# EAGLE design TLC (EAGLE 9.6.2)
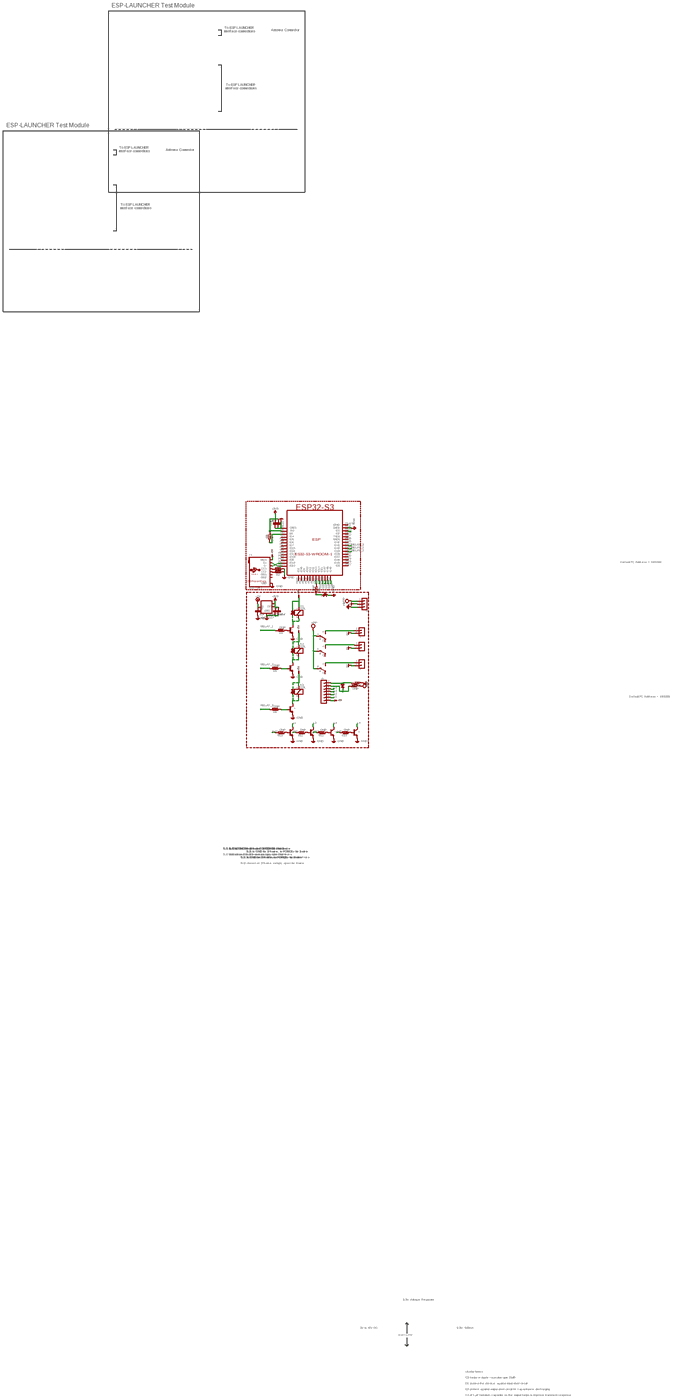
[diagram p0: schematic, sheet 1, overview]
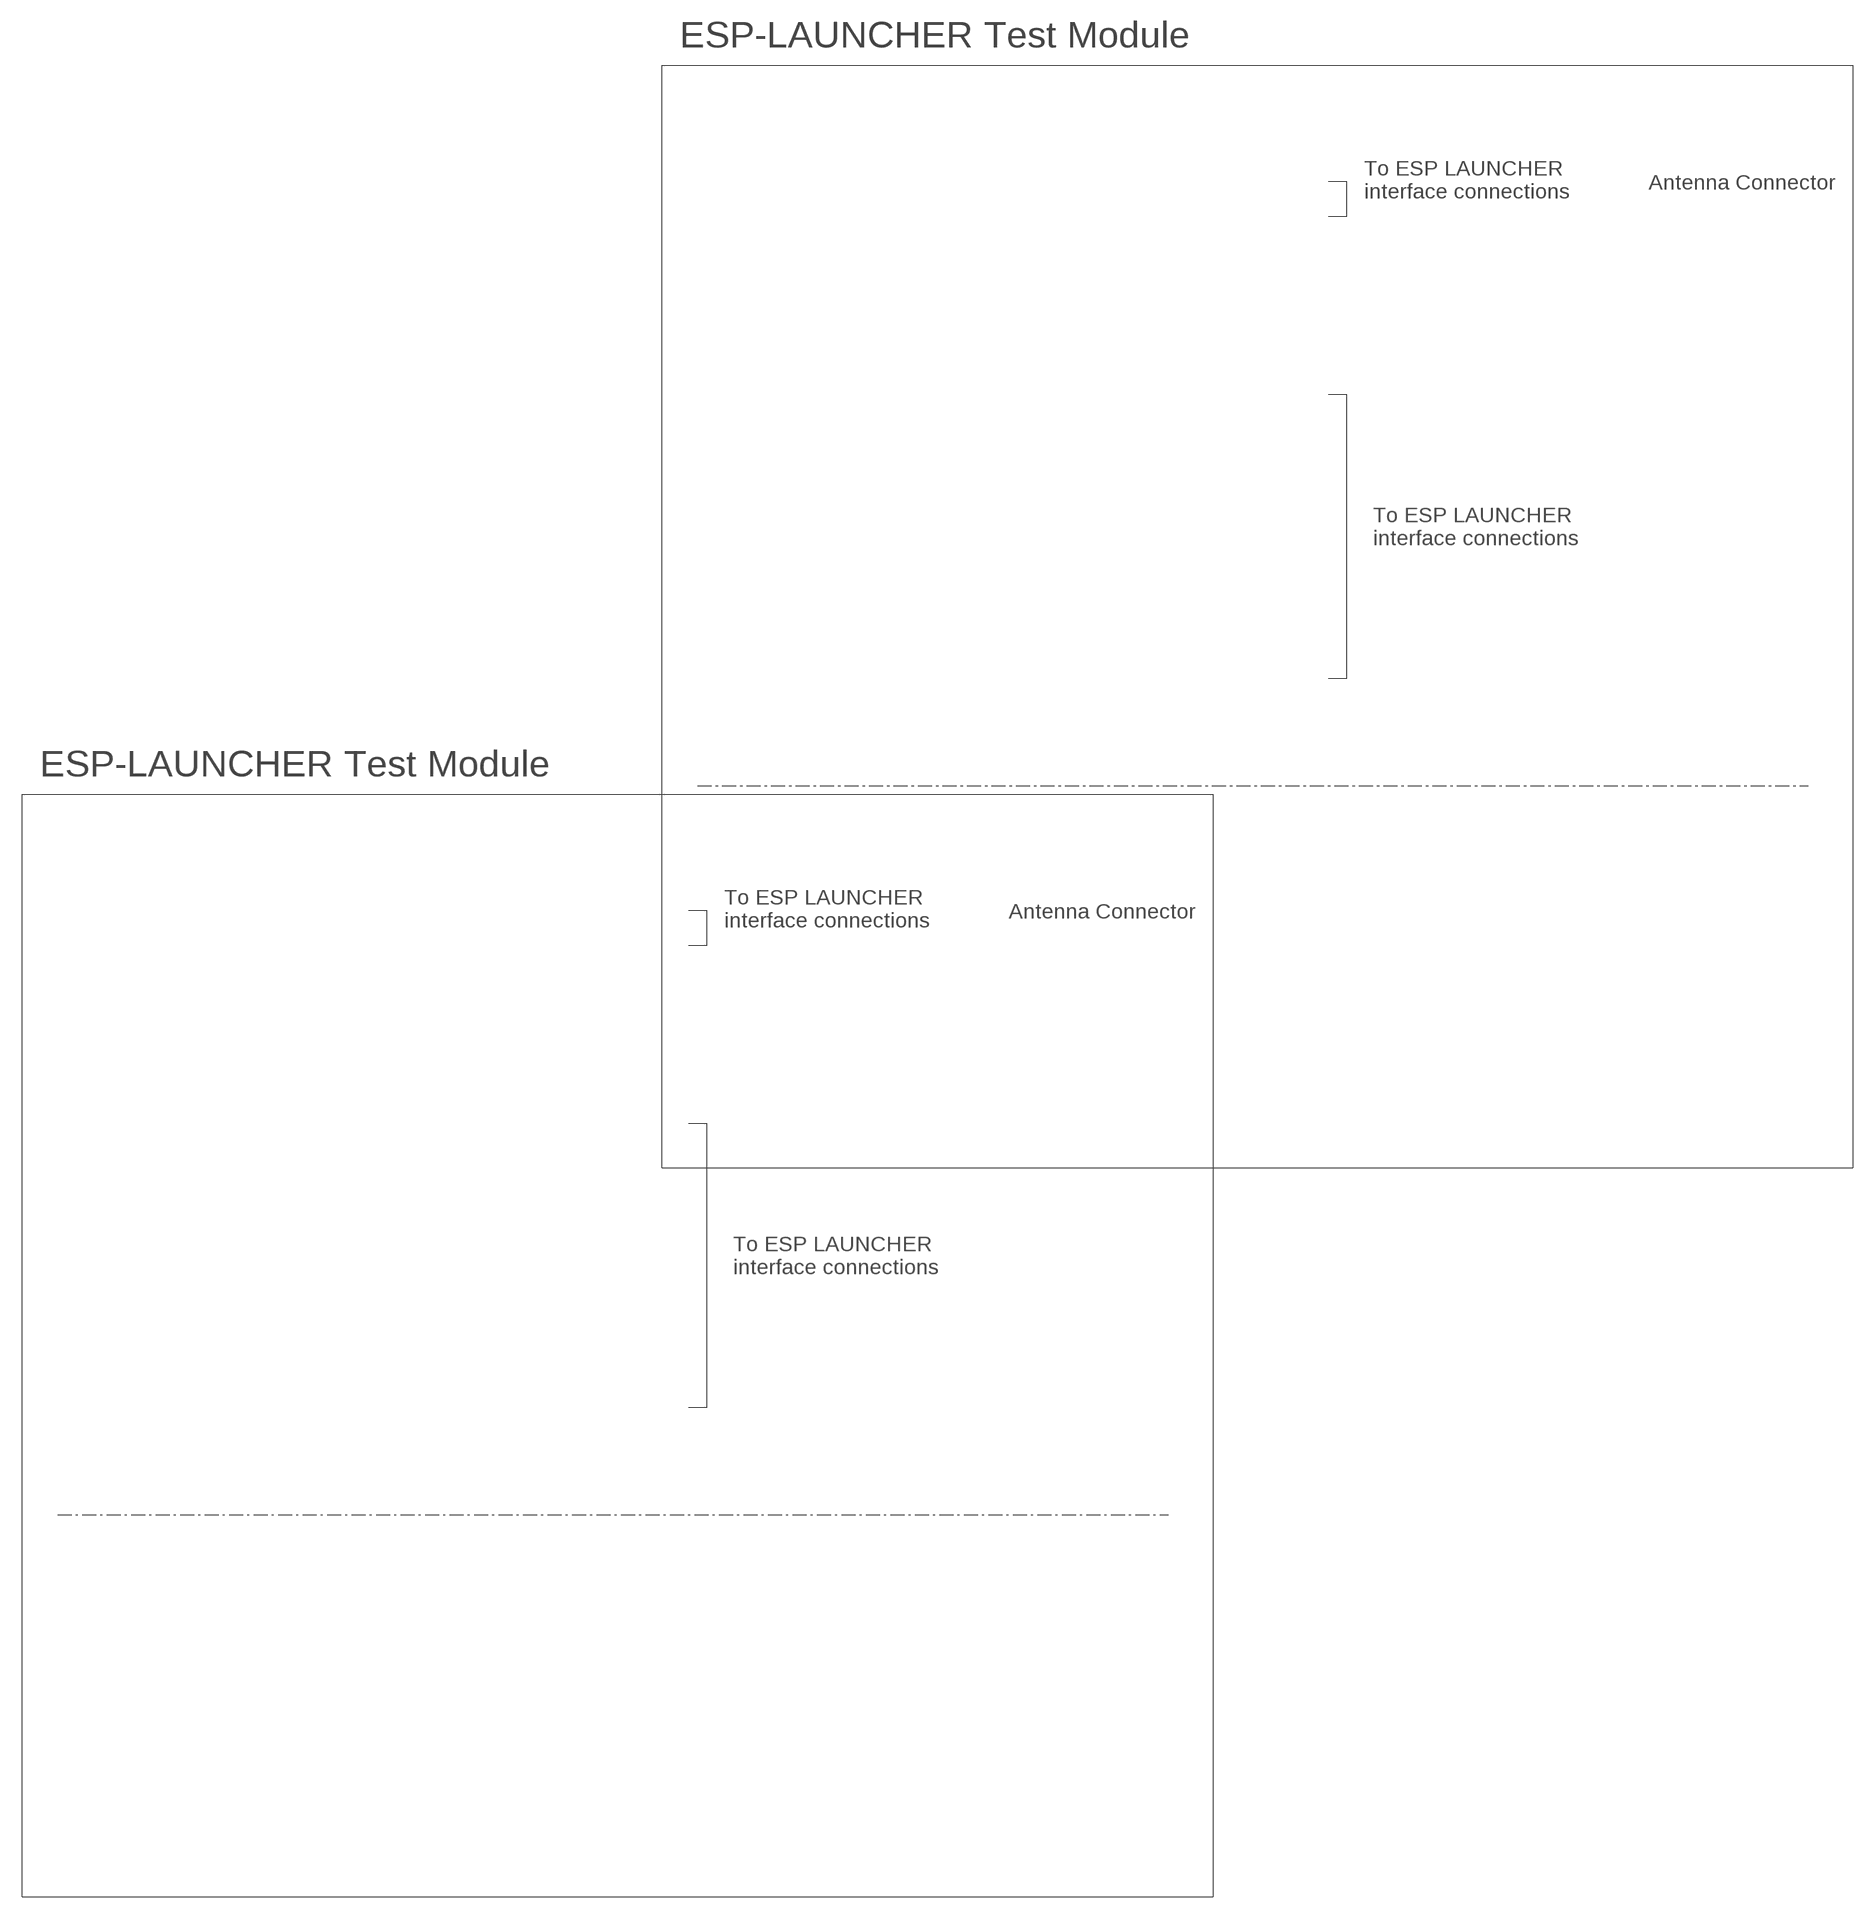
[diagram p1: schematic, sheet 1, part 1 of 4]
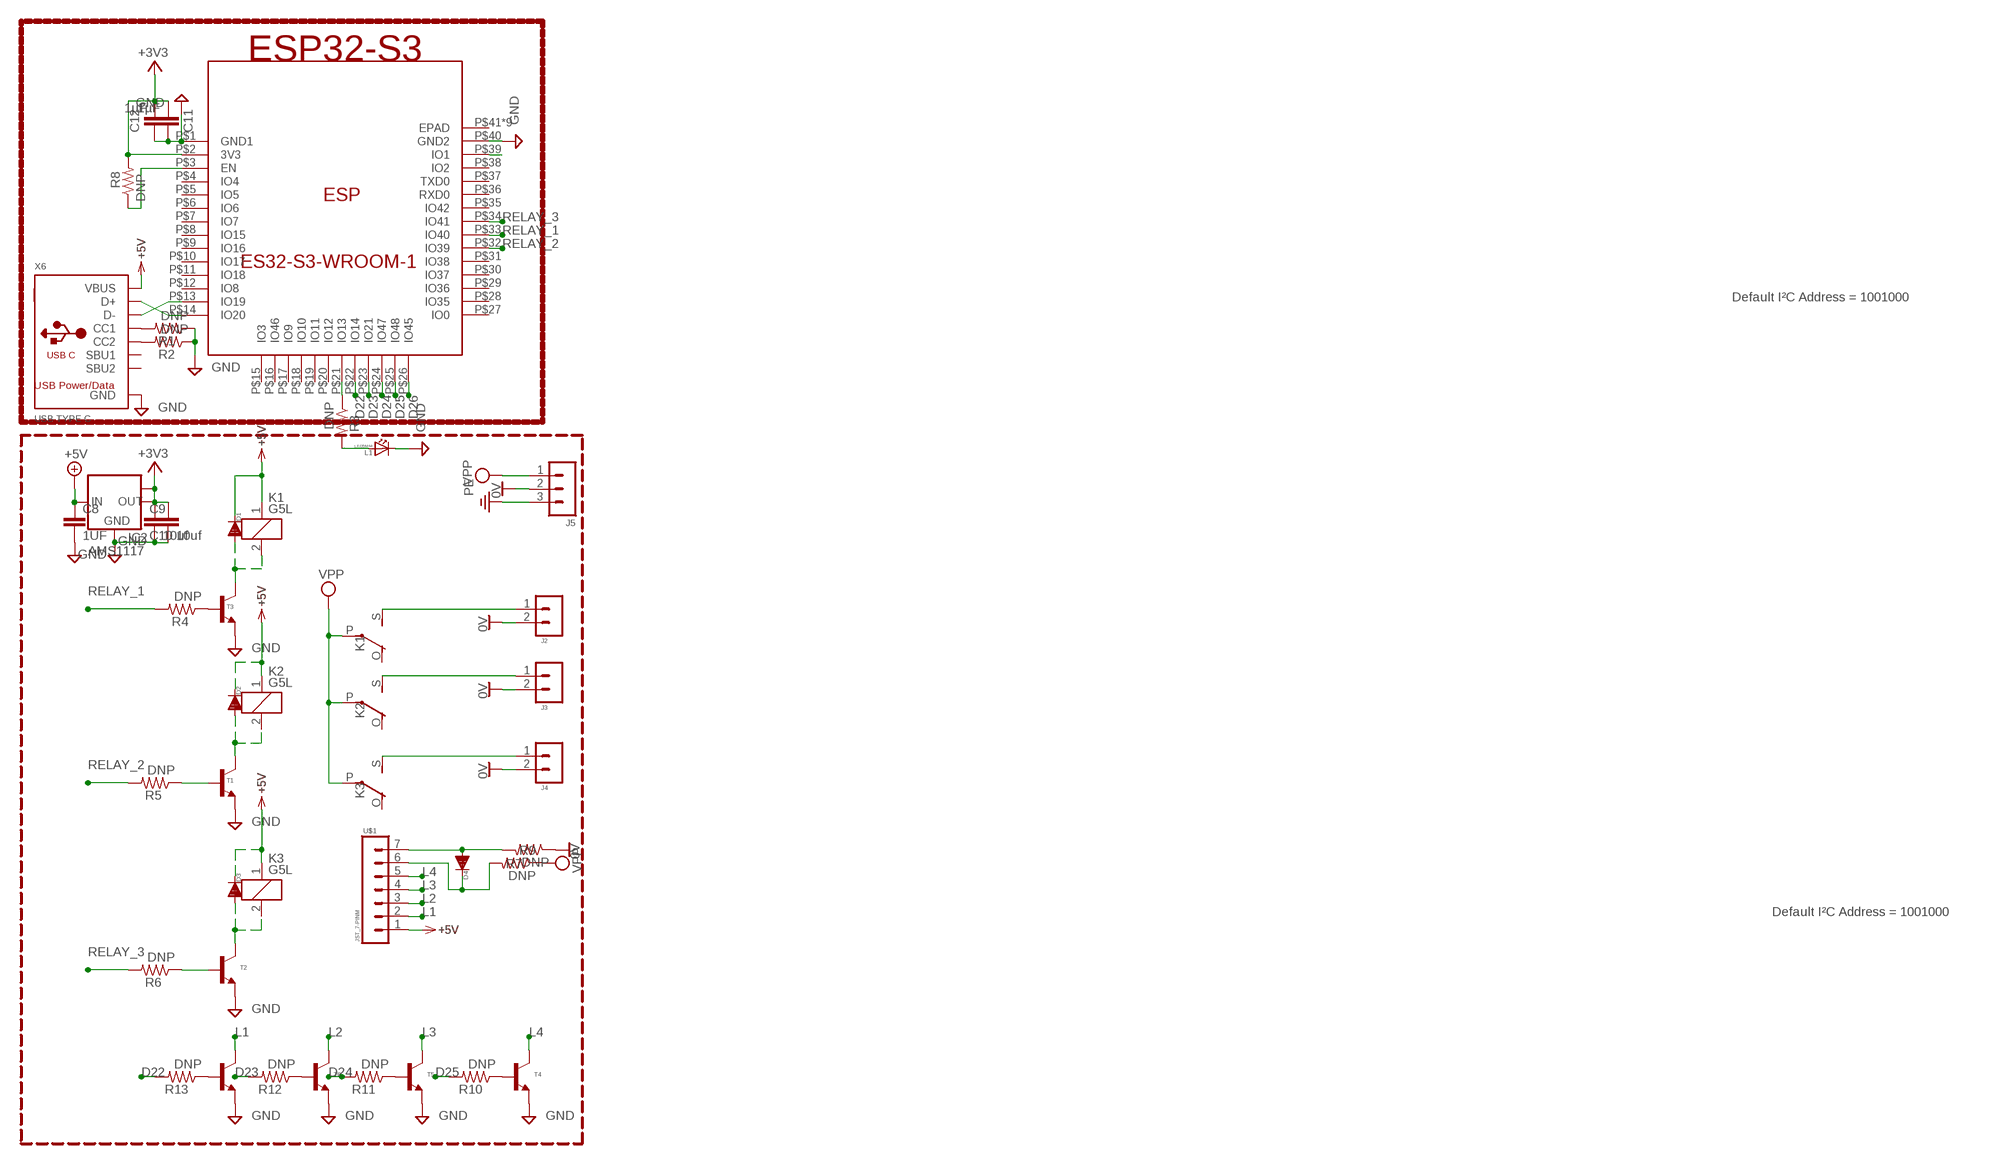
[diagram p2: schematic, sheet 1, part 2 of 4]
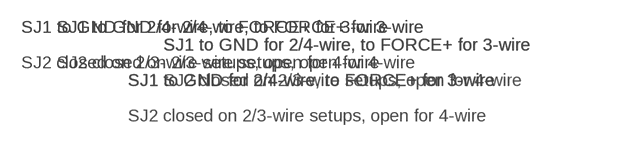
[diagram p3: schematic, sheet 1, part 3 of 4]
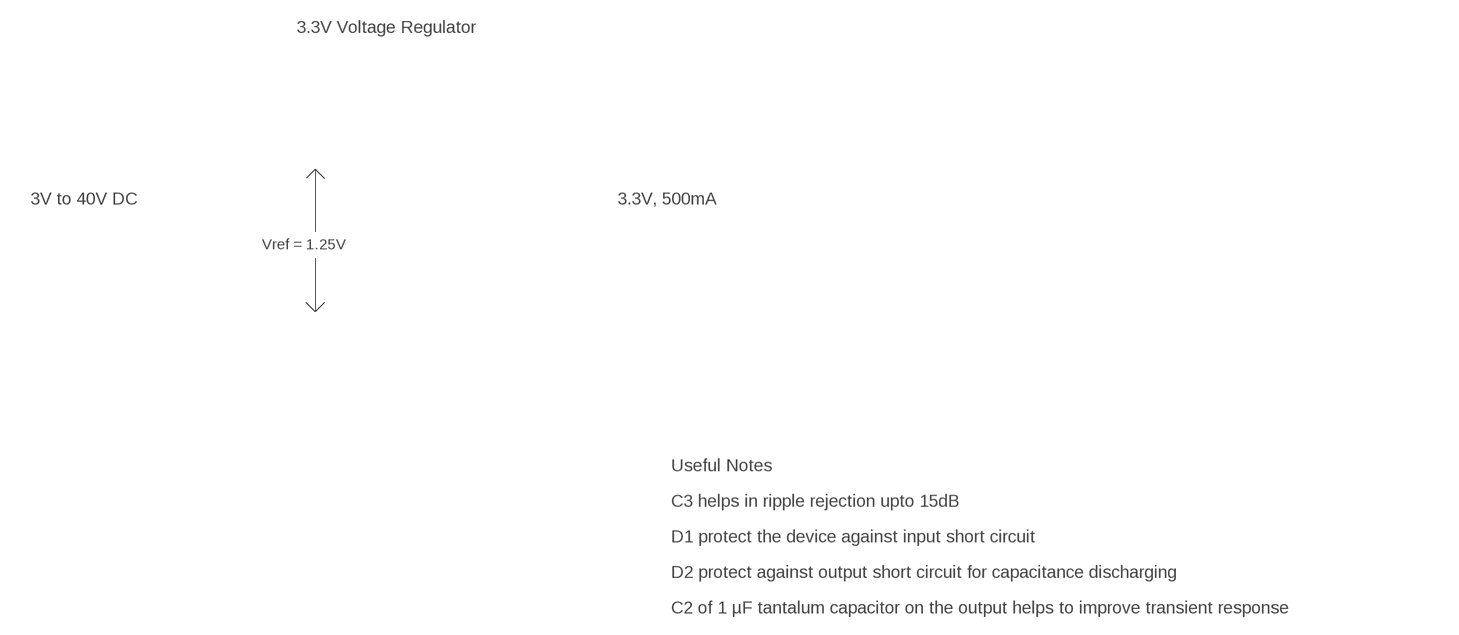
[diagram p4: schematic, sheet 1, part 4 of 4]

## Parts
C8  1UF  C-EUC1206K  [C1206K]
C9  10uf  C-EUC1206K  [C1206K]
C10  10uf  C-EUC1206K  [C1206K]
C11  1µF  C-EUC0805K  [C0805K]
C12  1µF  C-EUC0805K  [C0805K]
D1  DIODE80  [SOD-80]
D2  DIODE80  [SOD-80]
D3  DIODE80  [SOD-80]
D4  DIODE80  [SOD-80]
ESP  ES32-S3-WROOM-1  [ESP32-S3-WROOM-1]
IC2  AMS1117  LM1117MPX-5.0  [SOT223]
J2  JST_2-PIN_1.27MMBPT_3.5MM  [BPT-2_PIN_3.5MM]
J3  JST_2-PIN_1.27MMBPT_3.5MM  [BPT-2_PIN_3.5MM]
J4  JST_2-PIN_1.27MMBPT_3.5MM  [BPT-2_PIN_3.5MM]
J5  JST_3-PINPWR_3  [3-PIN_3.96_PWR]
K1  G5L  [G5LE]
K2  G5L  [G5LE]
K3  G5L  [G5LE]
L1  LED5MM  [LED_5MM]
R1  DNP  R-US_R0603  [R0603]
R2  DNP  R-US_R0603  [R0603]
R3  DNP  R-US_R0603  [R0603]
R4  DNP  R-US_R0603  [R0603]
R5  DNP  R-US_R0603  [R0603]
R6  DNP  R-US_R1206  [R1206]
R7  DNP  R-US_R0603  [R0603]
R8  DNP  R-US_R0603  [R0603]
R9  DNP  R-US_R0603  [R0603]
R10  DNP  R-US_R0603  [R0603]
R11  DNP  R-US_R0603  [R0603]
R12  DNP  R-US_R0603  [R0603]
R13  DNP  R-US_R0603  [R0603]
T1  TRANSISTOR_NPNSOT-23  [SOT-23]
T2  TRANSISTOR_NPNSOT-23  [SOT-23]
T3  TRANSISTOR_NPNSOT-23  [SOT-23]
T4  TRANSISTOR_NPNSOT-23  [SOT-23]
T5  TRANSISTOR_NPNSOT-23  [SOT-23]
T6  TRANSISTOR_NPNSOT-23  [SOT-23]
T7  TRANSISTOR_NPNSOT-23  [SOT-23]
U$1  JST_7-PINM  [MOLEX_7-PIN]
X6  USB TYPE C  USB_C  [USB_C_CUSB31-CFM2AX-01-X]

## Nets
0V: J2.2 J3.2 J4.2 J5.2 R9.1
+3V3: C9.1 C10.1 C11.2 C12.2 ESP.P$2(3V3) IC2.2(OUT) IC2.TAB(OUT1) R8.2
+5V: C8.1 D1.K D2.K D3.K IC2.3(IN) K1.1 K2.1 K3.1 U$1.1 X6.A4B9(VBUS) X6.B4A9(VBUS)
D22: ESP.P$22(IO14) R13.2
D23: ESP.P$23(IO21) R12.2
D24: ESP.P$24(IO47) R11.2
D25: ESP.P$25(IO48) R10.2
D26: ESP.P$26(IO45)
GND: C8.2 C9.2 C10.2 C11.1 C12.1 ESP.P$1(GND1) ESP.P$40(GND2) IC2.1(GND) L1.K R1.1 R2.1 T1.2(E) T2.2(E) T3.2(E) T4.2(E) T5.2(E) T6.2(E) T7.2(E) X6.A1B12(GND) X6.B1A12(GND)
L1: T7.3(C) U$1.2
L2: T6.3(C) U$1.3
L3: T5.3(C) U$1.4
L4: T4.3(C) U$1.5
N$1: R1.2 X6.A5(CC1)
N$2: R2.2 X6.B5(CC2)
N$3: ESP.P$39(IO1)
N$4: ESP.P$21(IO13) R3.1
N$5: L1.A R3.2
N$6: R5.1 T1.1(B)
N$7: D4.K R7.2 U$1.6
N$8: R4.1 T3.1(B)
N$9: J4.1 K3.S(2:S)
N$10: D1.A K1.2 T3.3(C)
N$11: D4.A R9.2 U$1.7
N$12: D2.A K2.2 T1.3(C)
N$13: R10.1 T4.1(B)
N$14: R6.1 T2.1(B)
N$15: ESP.P$3(EN) R8.1
N$16: ESP.P$13(IO19) X6.A7(D-) X6.B7(D-)
N$17: ESP.P$14(IO20) X6.A6(D+) X6.B6(D+)
N$18: D3.A K3.2 T2.3(C)
N$19: J3.1 K2.S(2:S)
N$20: J2.1 K1.S(2:S)
N$22: R11.1 T5.1(B)
N$24: R12.1 T6.1(B)
N$26: R13.1 T7.1(B)
PE: J5.3
RELAY_1: ESP.P$33(IO40) R4.2
RELAY_2: ESP.P$32(IO39) R5.2
RELAY_3: ESP.P$34(IO41) R6.2
VPP: J5.1 K1.P(2:P) K2.P(2:P) K3.P(2:P) R7.1
Unconnected: ESP.P$4(IO4) ESP.P$5(IO5) ESP.P$6(IO6) ESP.P$7(IO7) ESP.P$8(IO15) ESP.P$9(IO16) ESP.P$10(IO17) ESP.P$11(IO18) ESP.P$12(IO8) ESP.P$15(IO3) ESP.P$16(IO46) ESP.P$17(IO9) ESP.P$18(IO10) ESP.P$19(IO11) ESP.P$20(IO12) ESP.P$27(IO0) ESP.P$28(IO35) ESP.P$29(IO36) ESP.P$30(IO37) ESP.P$31(IO38) ESP.P$35(IO42) ESP.P$36(RXD0) ESP.P$37(TXD0) ESP.P$38(IO2) ESP.P$41(EPAD) ESP.P$42(EPAD) ESP.P$43(EPAD) ESP.P$44(EPAD) ESP.P$45(EPAD) ESP.P$46(EPAD) ESP.P$47(EPAD) ESP.P$48(EPAD) ESP.P$49(EPAD) K1.O(2:O) K2.O(2:O) K3.O(2:O) X6.A8(SBU1) X6.B8(SBU2)

## Notes on the sheet
- ESP-LAUNCHER Test Module
- Antenna Connector
- To ESP LAUNCHER
  interface connections
- To ESP LAUNCHER
  interface connections
- ESP-LAUNCHER Test Module
- Antenna Connector
- To ESP LAUNCHER
  interface connections
- To ESP LAUNCHER
  interface connections
- Default I²C Address = 1001000
- USB Power/Data
- Default I²C Address = 1001000
- SJ1 to GND for 2/4-wire, to FORCE+ for 3-wire | SJ1 to GND for 2/4-wire, to FORCE+ for 3-wire | SJ1 to GND for 2/4-wire, to FORCE+ for 3-wire | SJ1 to GND for 2/4-wire, to FORCE+ for 3-wire
- SJ1 to GND for 2/4-wire, to FORCE+ for 3-wire | SJ1 to GND for 2/4-wire, to FORCE+ for 3-wire
- SJ2 closed on 2/3-wire setups, open for 4-wire | SJ2 closed on 2/3-wire setups, open for 4-wire
- SJ1 to GND for 2/4-wire, to FORCE+ for 3-wire | SJ1 to GND for 2/4-wire, to FORCE+ for 3-wire | SJ2 closed on 2/3-wire setups, open for 4-wire
- SJ2 closed on 2/3-wire setups, open for 4-wire
- 3.3V Voltage Regulator
- 3V to 40V DC | 3.3V, 500mA
- Vref = 1.25V
- Useful Notes
- C3 helps in ripple rejection upto 15dB
- D1 protect the device against input short circuit
- D2 protect against output short circuit for capacitance discharging
- C2 of 1 µF tantalum capacitor on the output helps to improve transient response

## Library data of the parts
C8-C12 = rcl:C-EU: CAPACITOR, European symbol; SPICEPREFIX: C
D1-D4 = Squadron:DIODE
ESP = ESP32 Module:ES32-S3-WROOM-1
IC2 = lm1117:LM1117MPX-*
J2-J4 = Squadron:JST_2-PIN_1.27MM
J5 = Squadron:JST_3-PIN
K1-K3 = relay:G5L: RELAY 1 x switch, 10 A/120 V AC, 8 A/30 V ADC, Omron
L1 = Squadron:LED
R1-R13 = rcl:R-US_: RESISTOR, American symbol; SPICEPREFIX: R
T1-T7 = Squadron:TRANSISTOR_NPN
U$1 = Squadron:JST_7-PIN
X6 = adafruit_electromech:USB_C: USB Type-C USB 2.0 Connector

## Module WAVESHAREDISPLAY
Ports: 

### Library data of the parts

## Board
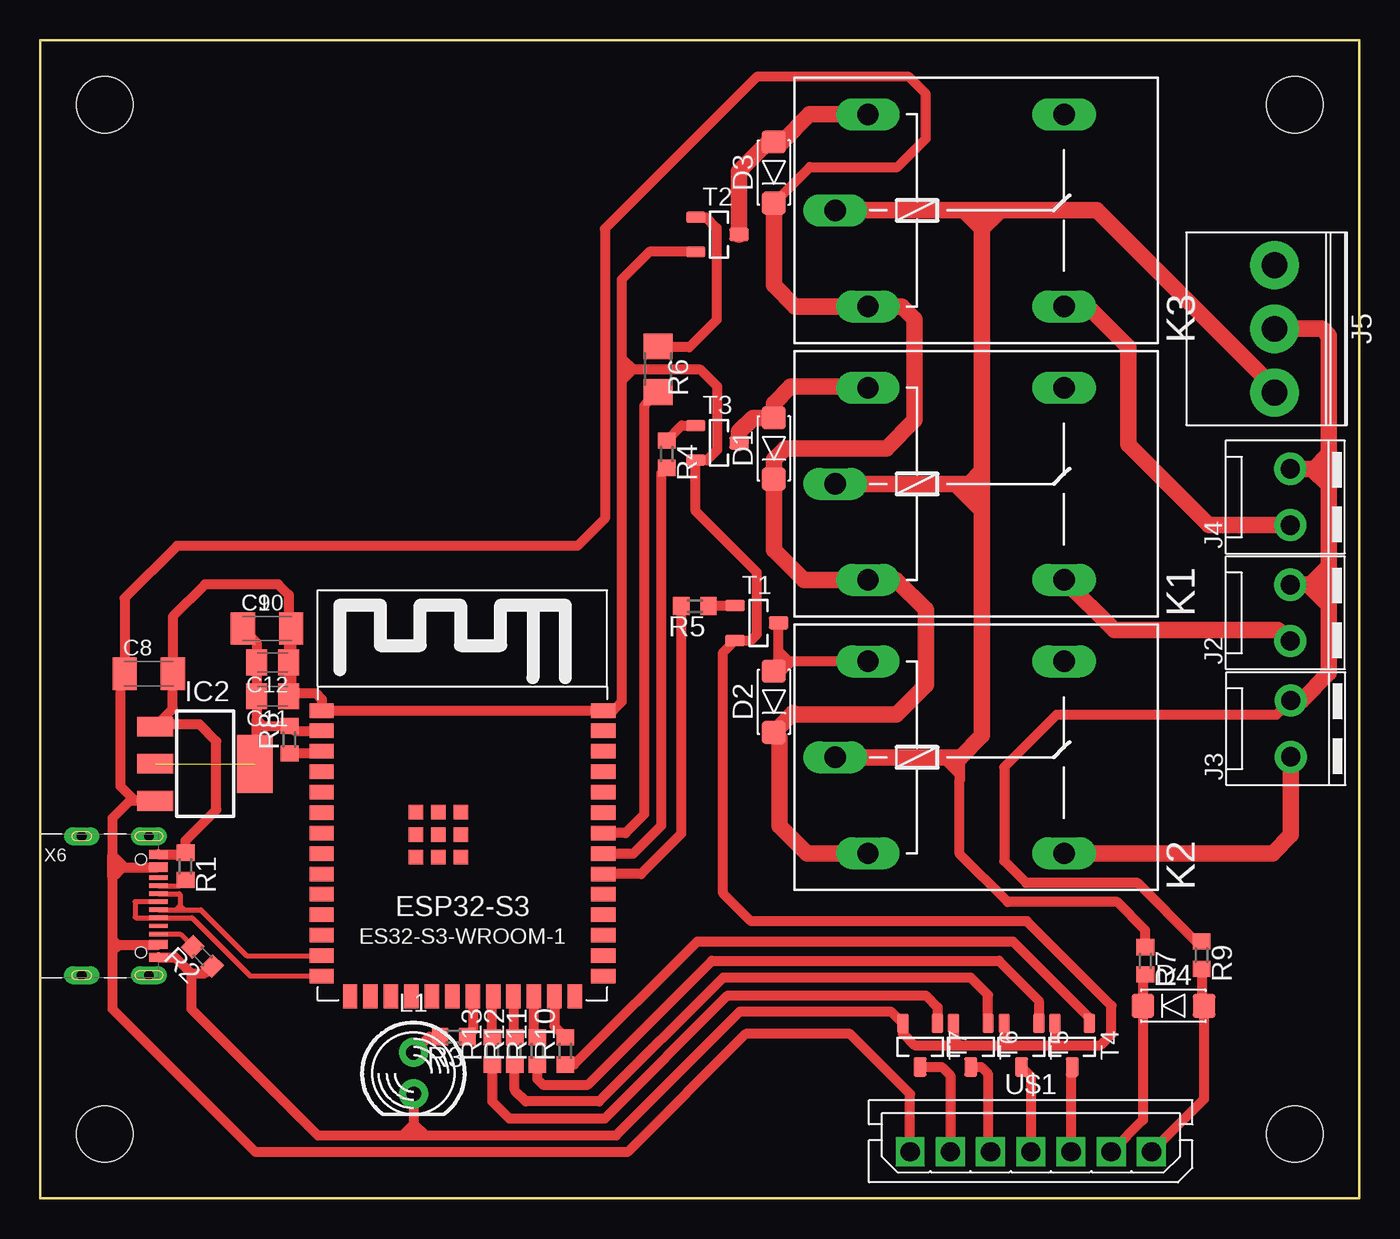
[diagram p5: board, top side]

Size 82 x 72 mm. Coordinates in mm from the lower left corner, seen from the top.
Outline: 0,0 82,0 82,72 0,72 0,0
Copper layers (1*16): Top 0.035mm / dielectric 1.5mm / Bottom 0.035mm
Design rules "default": minimum track width 6mil, minimum drill 0.35mm, track to track 6mil, track to pad 6mil, pad to pad 6mil, via to via 6mil, smd to smd 6mil, copper to edge 40mil, drill to drill 6mil, minimum pad ring 10mil, minimum via ring 8mil, stop-mask expansion 4mil, vias tented up to drill 0mil, thermal gap 10mil
Holes 3.5 mm at 4,68 4,4 78,4 78,68

### Footprints (pad centres in the part's own frame; a part is rotated, then mirrored left to right if it is on the bottom)
C1206K = smd 1.5 x 2: 1 -1.5,0; 2 1.5,0
C0805K = smd 1.3 x 1.6: 1 -1,0; 2 1,0
SOD-80 = smd 1.4 x 1.5: A -1.9,0; K 1.9,0
ESP32-S3-WROOM-1 = smd 1.5 x 0.9: P$1 0.25,18.01; P$2 0.25,16.74; P$3 0.25,15.47; P$4 0.25,14.2; P$5 0.25,12.93; P$6 0.25,11.66; P$7 0.25,10.39; P$8 0.25,9.12; P$9 0.25,7.85; P$10 0.25,6.58; P$11 0.25,5.31; P$12 0.25,4.04; P$13 0.25,2.77; P$14 0.25,1.5; P$27 17.75,1.5; P$28 17.75,2.77; P$29 17.75,4.04; P$30 17.75,5.31; P$31 17.75,6.58; P$32 17.75,7.85; P$33 17.75,9.12; P$34 17.75,10.39; P$35 17.75,11.66; P$36 17.75,12.93; P$37 17.75,14.2; P$38 17.75,15.47; P$39 17.75,16.74; P$40 17.75,18.01 | smd 0.9 x 1.5: P$15 2.015,0.25; P$16 3.285,0.25; P$17 4.555,0.25; P$18 5.825,0.25; P$19 7.095,0.25; P$20 8.365,0.25; P$21 9.635,0.25; P$22 10.905,0.25; P$23 12.175,0.25; P$24 13.445,0.25; P$25 14.715,0.25; P$26 15.985,0.25 | smd 0.9 x 0.9: P$41 6.1,11.69; P$42 7.5,11.69; P$43 8.9,11.69; P$44 6.1,10.29; P$45 7.5,10.29; P$46 8.9,10.29; P$47 6.1,8.89; P$48 7.5,8.89; P$49 8.9,8.89
SOT223 = smd 1.219 x 2.235: 1 -2.311,-3.099; 2 0,-3.099; 3 2.311,-3.099 | smd 3.6 x 2.2: TAB 0,3.099
BPT-2_PIN_3.5MM = drill 1.2 pad 2: 1 -1.75,0; 2 1.75,0
3-PIN_3.96_PWR = drill 1.6 pad 3: 1 3.96,5.5; 2 0,5.5; 3 -3.96,5.5
G5LE = drill 1.321 long: 1 -7.493,-5.969; 2 -7.493,5.969; O 4.699,5.969; P -9.525,0; S 4.699,-5.969
LED_5MM = drill 0.9 pad 1.8: A 0,-1.295; K -0.025,1.27
R0603 = smd 1 x 1.1: 1 -0.85,0; 2 0.85,0
R1206 = smd 1.6 x 1.803: 1 -1.422,0; 2 1.422,0
SOT-23 = smd 0.7 x 1.2: 1 -1.077,-1.35; 2 1.077,-1.35 | smd 0.8 x 1.2: 3 0,1.35
MOLEX_7-PIN = drill 1.2 pad 1.75 square: 1 7.5,0; 2 5,0; 3 2.5,0; 4 0,0; 5 -2.5,0; 6 -5,0; 7 -7.5,0
USB_C_CUSB31-CFM2AX-01-X = smd 0.575 x 1.15: A1B12 -3.2,3.545; A4B9 -2.4,3.545; B1A12 3.2,3.545; B4A9 2.4,3.545 | smd 0.275 x 1.15: A5 -1.25,3.545; A6 -0.25,3.545; A7 0.25,3.545; A8 1.25,3.545; B5 1.75,3.545; B6 0.75,3.545; B7 -0.75,3.545; B8 -1.75,3.545 | drill 0.6 pad 1 long: M1 -4.32,2.97; M2 4.32,2.97; M3 -4.32,-1.21; M4 4.32,-1.21 | hole 0.65: 2.89,2.47; -2.89,2.47

### Placement (x,y rotation side)
C8  6.75,32.62 0 top
C9  14.1,35.42 0 top
C10  14.1,35.42 0 top
C11  14.45,31.22 180 top
C12  14.45,33.32 180 top
D1  45.6,46.62 270 top
D2  45.6,30.87 270 top
D3  45.6,63.77 270 top
D4  70.45,11.97 180 top
ESP  17.25,12.32 0 top
IC2  10.25,27.02 270 top
J2  77.71,36.4 90 top
J3  77.74,29.2 90 top
J4  77.71,43.6 90 top
J5  71.24,54.06 270 top
K1  58.95,44.42 0 top
K2  58.95,27.42 0 top
K3  58.95,61.42 0 top
L1  23.2,7.77 180 top
R1  9.04,20.64 270 top
R2  10.09,15.04 135 top
R3  25.7,10.05 180 top
R4  38.95,46.27 270 top
R5  40.7,36.82 180 top
R6  38.4,51.54 270 top
R7  68.7,14.77 270 top
R8  15.5,28.52 90 top
R9  72.2,15.12 270 top
R10  32.65,9.17 90 top
R11  30.9,9.17 90 top
R12  29.5,9.17 90 top
R13  28.1,9.17 90 top
T1  44.55,35.77 270 top
T2  42.1,59.92 270 top
T3  42.1,46.97 270 top
T4  64.15,9.52 180 top
T5  61,9.52 180 top
T6  57.85,9.52 180 top
T7  54.7,9.52 180 top
U$1  61.58,2.9 180 top
X6  3.79,18.19 270 top

### Tracks (layer width: path | path; a pad name or v marks a point on that pad's centre or on a via)
0V
  Top 0.61: R9.1 71.85,15.97 68.22,19.6 61.3,19.6 59.93,20.97 59.93,26.82 63.17,30.06 76.85,30.06 J3.2
  Top 1.016: J3.2 78.41,30.95 80.11,32.65 80.11,36.85 | 78.81,38.15 80.11,36.85 | 78.81,38.15 J2.2 79.66,38.15 80.11,38.6 | 80.11,36.85 80.11,38.6 | 80.11,38.6 80.11,39.3 | 80.11,39.3 80.11,44.3 | 80.11,44.3 80.11,44.9 | 79.16,45.35 79.66,45.35 80.11,44.9 | J4.2 79.06,45.35 | J5.2 79.7,54.06 80.11,53.65 80.11,46.3 | 80.11,46.3 80.11,44.9 | 79.06,45.35 79.16,45.35 | 79.16,45.35 80.11,46.3 | 79.06,45.35 80.11,44.3 | 78.81,38.15 78.96,38.15 80.11,39.3
+3V3  (1 unrouted)
  Top 0.61: IC2.TAB 13.4,27.02 13.75,26.67 13.7,26.67 IC2.TAB | IC2.TAB 13.45,27.12 13.45,29.77 | 13.45,29.77 C11.2 C12.2 13.45,34.57 C10.1 | 13.45,29.77 13.85,29.37 R8.2 15.81,29.06 ESP.P$2
+5V
  Top 0.61: 46.8,30.17 46.73,30.09 45.85,29.22 D2.K | 4.78,20.23 4.49,19.94 | 4.67,20.11 5.14,20.59 | 5.14,20.59 X6.A4B9 | D3.K 47.85,64.12 53.3,64.12 55.05,65.87 55.05,68.67 54,69.72 44.55,69.72 35.1,60.27 35.1,42.27 33.4,40.57 8.5,40.57 5.25,37.32 C8.1 5,32.37 5,25.62 5.91,24.71 IC2.3 | U$1.1 54.08,6.49 50.35,10.22 43.85,10.22 36.5,2.87 13.4,2.87 4.49,11.78 4.49,15.39 | 4.49,19.94 4.49,16.09 | 4.49,16.09 4.49,15.74 | 4.49,15.74 4.49,15.39 | X6.B4A9 7.29,15.74 4.84,15.74 | 4.49,15.74 4.84,15.74 | 4.84,15.74 4.49,16.09 | 4.84,15.74 4.49,15.39 | 4.49,19.94 4.49,21.34 | 5.14,20.59 5.14,20.69 4.49,21.34 | IC2.3 7.01,24.57 | IC2.3 5.57,24.71 4.49,23.63 4.49,21.34
  Top 1.016: K2.1 47.67,21.45 45.95,23.17 45.95,28.62 D2.K | D3.K 45.6,56.77 46.92,55.45 K3.1 53.57,55.45 54.35,54.67 54.35,48.37 52.6,46.62 46.3,46.62 45.6,45.92 D1.K 45.6,40.32 47.47,38.45 K1.1 53.21,38.45 55.05,36.61 55.05,31.92 53.23,30.09 46.73,30.09 | 46.8,30.17 45.85,29.22
D22
  Top 0.61: R13.2 28.1,12.52 ESP.P$22
D23
  Top 0.61: ESP.P$23 29.43,10.1 R12.2
D24
  Top 0.61: R11.2 30.7,10.22 ESP.P$24
D25
  Top 0.61: ESP.P$25 31.96,10.71 R10.2
GND
  Top 0.305: R1.1 7.85,21.49 7.75,21.39
  Top 0.61: T2.2 37.87,58.84 36.15,57.12 36.15,52.22 | 36.15,52.22 36.15,51.52 | 36.15,51.52 36.15,50.82 | 36.15,50.82 36.15,30.87 35.61,30.33 ESP.P$40 ESP.P$1 17.5,31.03 17.15,31.38 15.61,31.38 C11.1 15.45,31.57 | 62.75,9.52 63.1,9.87 63.1,10.84 T4.2 | 56.45,9.52 54.35,9.52 53.62,10.25 T7.2 52.87,11.62 43.5,11.62 35.8,3.92 23.9,3.92 | 56.45,9.52 56.8,9.52 | 56.8,9.52 57.15,9.52 | 57.15,9.52 59.6,9.52 | 59.6,9.52 59.95,9.52 | 59.95,9.52 60.3,9.52 | 60.3,9.52 62.75,9.52 | 59.92,9.84 59.92,9.55 59.95,9.52 | T5.2 59.92,9.87 | 59.92,9.87 59.92,9.84 | 59.92,9.84 59.6,9.52 | 59.92,9.87 59.95,9.87 60.3,9.52 | T6.2 56.8,10.84 56.8,9.87 | 56.8,9.87 56.8,9.52 | 56.8,9.87 56.45,9.52 | 56.8,9.87 57.15,9.52 | X6.B1A12 8.39,14.99 9.39,13.99 | 23.2,3.92 23.9,3.92 | X6.A1B12 8.94,21.39 R1.1 9.04,22.24 10.95,24.15 10.95,28.42 9.9,29.47 7.15,29.47 IC2.1 8.25,30.43 C8.2 8.25,36.17 10.25,38.17 14.8,38.17 15.45,37.52 C12.1 15.45,31.92 | 36.85,51.52 41.05,51.52 42.1,50.47 42.1,46.54 41.45,45.89 T3.2 40.75,42.72 44.55,38.92 44.55,35.07 44.17,34.69 T1.2 42.45,33.94 42.45,18.97 44.2,17.22 61.35,17.22 66.6,11.97 66.6,10.22 65.9,9.52 62.75,9.52 | 36.15,51.52 36.85,51.52 | 36.15,52.22 36.85,51.52 | 36.85,51.52 36.15,50.82 | 15.45,31.92 15.45,31.57 | 15.45,31.57 15.6,31.72 C10.2 15.6,32.07 15.45,31.92 | 9.39,13.99 10.24,13.99 R2.1 | 9.39,13.99 9.39,11.78 17.25,3.92 22.52,3.92 | 22.52,3.92 23.2,3.92 | L1.K 23.23,4.62 | 23.23,4.62 23.23,3.94 23.2,3.92 | 23.23,4.62 22.52,3.92 | 23.23,4.62 23.9,3.94 23.9,3.92
L1
  Top 0.61: T7.3 56.05,8.17 56.58,7.64 U$1.2
L2
  Top 0.61: T6.3 58.5,8.17 58.9,7.77 58.9,3.08 U$1.3
L3
  Top 0.61: T5.3 61.58,7.59 U$1.4
L4
  Top 0.61: T4.3 64.08,8.1 U$1.5
N$1
  Top 0.305: X6.A5 8.69,19.44 R1.2
N$2
  Top 0.305: X6.B5 8.69,16.44 R2.2
N$4
  Top 0.61: R3.1 26.9,10.4 26.9,12.55 ESP.P$21
N$5
  Top 0.61: L1.A 24.18,10.05 R3.2
N$6
  Top 0.61: T1.1 43.17,36.82 R5.1
N$7
  Top 0.61: R7.2 68.55,13.77 D4.K 68.55,4.87 U$1.6
N$8
  Top 0.61: R4.1 39.88,48.05 T3.1
N$9
  Top 1.016: K3.S 65.12,55.45 67.65,52.92 67.65,46.86 72.66,41.85 J4.1
N$10
  Top 1.016: K1.2 51.38,50.47 46.65,50.47 45.6,49.42 D1.A 44.3,48.52 43.45,47.67 T3.3
N$11
  Top 0.61: R9.2 72.2,12.12 D4.A 72.35,6.17 U$1.7
N$12
  Top 0.61: 45.9,33.07 45.9,34.02 | 45.9,34.02 T1.3 | 45.9,33.07 46.22,33.39 46.53,33.39 | K2.2 46.65,33.39 | 46.65,33.39 46.53,33.39 | 46.53,33.39 45.9,34.02 | 46.65,33.39 46.65,33.32 45.95,32.62 45.75,32.62 D2.A 45.9,33.07
N$13
  Top 0.61: T4.1 65.23,11.22 60.5,15.95 40.83,15.95 33.2,8.32 R10.1
N$14
  Top 0.61: T2.1 41.37,61 42.04,60.33 42.04,54.61 40.35,52.92 38.44,52.92 R6.1
N$15
  Top 0.61: ESP.P$3 17.38,27.67 R8.1
N$16
  Top 0.305: X6.A7 8.44,17.94 | 8.44,17.94 8.69,17.94 | 8.69,17.94 8.94,17.94 | 8.94,17.94 9.99,17.94 12.84,15.09 ESP.P$13 | X6.B7 8.64,18.94 8.69,18.89 8.69,18.19 | 8.69,17.94 8.69,18.19 | 8.69,18.19 8.44,17.94 | 8.69,18.19 8.94,17.94
N$17
  Top 0.305: ESP.P$14 13.06,13.82 9.44,17.44 X6.B6 5.94,17.44 5.89,17.49 5.89,18.44 X6.A6
N$18
  Top 1.016: T2.3 43.45,63.87 45.25,65.67 D3.A 46.1,65.67 47.82,67.39 K3.2
N$19
  Top 1.016: K2.S 76.61,21.45 77.74,22.58 J3.1
N$20
  Top 1.016: J2.1 76.93,35.33 66.77,35.33 K1.S
N$22
  Top 0.61: R11.1 30.9,7.42 31.25,7.07 34.05,7.07 41.75,14.77 59.6,14.77 62.08,12.29 T5.1
N$24
  Top 0.61: 29.64,8.18 R12.1 29.5,6.72 30.2,6.02 34.75,6.02 42.45,13.72 57.85,13.72 58.93,12.64 T6.1
N$26
  Top 0.61: 55.78,11.24 T7.1 55.78,11.88 55.05,12.61 42.74,12.61 35.1,4.97 29.15,4.97 28.1,6.02 R13.1
RELAY_1
  Top 0.61: ESP.P$33 36.87,21.44 38.6,23.17 38.6,45.07 R4.2
RELAY_2
  Top 0.61: R5.2 39.85,22.67 37.35,20.17 ESP.P$32
RELAY_3
  Top 0.61: R6.2 37.55,49.27 37.55,23.87 36.39,22.71 ESP.P$34
VPP
  Top 0.61: R7.1 68.7,16.67 66.95,18.42 60.15,18.42 57.15,21.42 57.15,25.97 | 57.15,25.97 57.15,26.37 56.1,27.42 | 54.75,27.42 55,27.42 | 57.15,25.97 57.2,26.02 57.2,27.42
  Top 1.016: K2.P 54.75,27.42 56.1,27.42 57.2,27.42 58.55,28.77 58.55,42.77 | 58.55,60.27 58.55,45.22 | 58.55,45.22 58.55,42.77 | 58.55,45.22 57.75,44.42 K1.P 56.9,44.42 58.55,42.77 | K3.P 57.4,61.42 | 57.4,61.42 58.55,60.27 | J5.1 76.74,50.37 65.69,61.42 59.6,61.42 | 59.6,61.42 57.4,61.42 | 58.55,60.27 59.6,61.32 59.6,61.42